# Altium schematic sheet auto-psu_E3_schematic.SchDoc: Блок автономного
size 420 x 297 mm; Author: Советников; Organization: ООО "Аксима"; DocumentNumber: Э3; SheetNumber: 1; SheetTotal: 1; Title2str: питания (v3); SheetType: Схема электрическая принципиальная
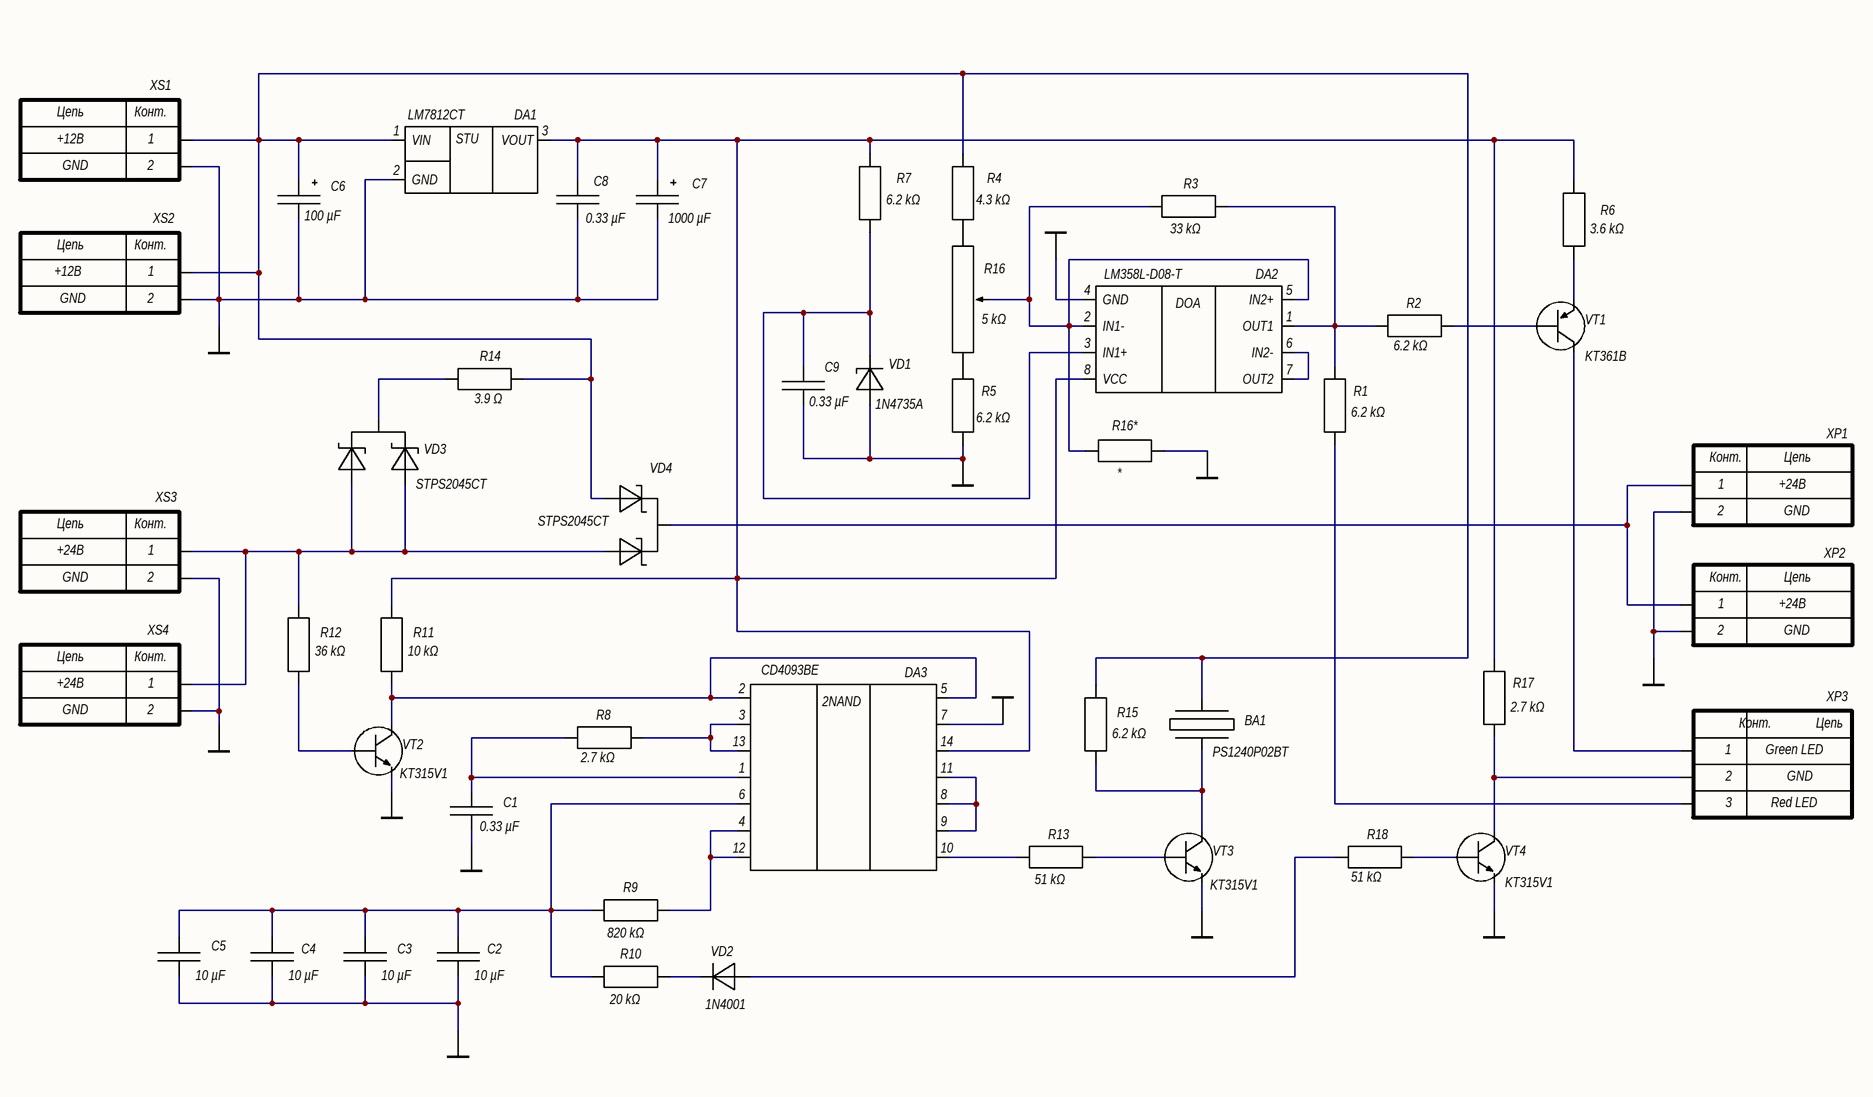
[diagram p0: auto-psu_E3_schematic.SchDoc]

## Parts
BA1  PS1240P02BT  [BA_PS12 BUZZER]
C1  0.33 µF  [C_MLCC]
C2  10 µF  [C_MLCC]
C3  10 µF  [C_MLCC]
C4  10 µF  [C_MLCC]
C5  10 µF  [C_MLCC]
C6  100 µF  [C+_6,3 MM]
C7  1000 µF  [C+_10MM]
C8  0.33 µF  [C_MLCC]
C9  0.33 µF  [C_MLCC]
DA1  LM7812CT  [DD_TO-220]
DA2  LM358L-D08-T  [DA_DIP8]
DA3  CD4093BE  [DA_DIP14]
R1  6.2 kΩ  [R_CF-25_C1-4]
R2  6.2 kΩ  [R_CF-25_C1-4]
R3  33 kΩ  [R_CF-25_C1-4]
R4  4.3 kΩ  [R_CF-25_C1-4]
R5  6.2 kΩ  [R_CF-25_C1-4]
R6  3.6 kΩ  [R_CF-25_C1-4]
R7  6.2 kΩ  [R_CF-25_C1-4]
R8  2.7 kΩ  [R_CF-25_C1-4]
R9  820 kΩ  [R_CF-25_C1-4]
R10  20 kΩ  [R_CF-25_C1-4]
R11  10 kΩ  [R_CF-25_C1-4]
R12  36 kΩ  [R_CF-25_C1-4]
R13  51 kΩ  [R_CF-25_C1-4]
R14  3.9 Ω  [R_SQP 5W]
R15  6.2 kΩ  [R_CF-25_C1-4]
R16  5 kΩ  [R_3362P(POT)]
R16*  *  [R_CF-25_C1-4]
R17  2.7 kΩ  [R_CF-25_C1-4]
R18  51 kΩ  [R_CF-25_C1-4]
VD1  1N4735A  [VD_DO-41]
VD2  1N4001  [VD_DO-41]
VD3  STPS2045CT  [VD_TO-220AB]
VD4  STPS2045CT  [VD_TO-220AB (HIGH)]
VT1  KT361B  [VT_KT-13]
VT2  KT315V1  [VT_TO-92]
VT3  KT315V1  [VT_TO-92]
VT4  KT315V1  [VT_TO-92]
XP1  15EDGVC-3.5-02  [X_15EDGVC_2P]  (value not drawn)
XP2  15EDGRC-3.5-02  [X_15EDGRC_2P]  (value not drawn)
XP3  15EDGVC-3.5-03P-14-00AH  [X_15EDGVC_3P]  (value not drawn)
XS1  15EDGVC-3.5-02  [X_15EDGVC_2P]  (value not drawn)
XS2  15EDGRC-3.5-02  [X_15EDGRC_2P]  (value not drawn)
XS3  15EDGVC-3.5-02  [X_15EDGVC_2P]  (value not drawn)
XS4  15EDGRC-3.5-02  [X_15EDGRC_2P]  (value not drawn)

## Nets
GND: C1.1 C2.1 C3.1 C4.1 C5.1 C6.1 C7.1 C8.1 C9.1 DA1.2(GND) DA2.4(GND) DA3.7 R5.1 R16*.1 VD1.1 VT2.3(Э) VT3.3(Э) VT4.3(Э) XP1.2 XP2.2 XS1.2 XS2.2 XS3.2 XS4.2
NetBA1_1: BA1.1 C6.2 DA1.1(VIN) R4.2 R14.2 R15.2 VD4.3(A2) XS1.1 XS2.1
NetBA1_2: BA1.2 R15.1 VT3.2(К)
NetC1_2: C1.2 DA3.1 R8.2
NetC2_2: C2.2 C3.2 C4.2 C5.2 DA3.6 R9.2 R10.2
NetC7_2: C7.2 C8.2 DA1.3(VOUT) DA2.8(VCC) DA3.14 R6.2 R7.2 R11.1 R17.1
NetC9_2: C9.2 DA2.3(IN1+) R7.1 VD1.2
NetDA2_1: DA2.1(OUT1) R1.2 R2.2 R3.1
NetDA2_2: DA2.2(IN1-) DA2.5(IN2+) R3.2 R16.3 R16*.2
NetDA2_6: DA2.6(IN2-) DA2.7(OUT2)
NetDA3_2: DA3.2 DA3.5 R11.2 VT2.2(К)
NetDA3_3: DA3.3 DA3.13 R8.1
NetDA3_4: DA3.4 DA3.12 R9.1
NetDA3_8: DA3.8 DA3.9 DA3.11
NetDA3_10: DA3.10 R13.1
NetR1_1: R1.1 XP3.3
NetR2_1: R2.1 VT1.1(Б)
NetR4_1: R4.1 R16.2
NetR5_2: R5.2 R16.1
NetR6_1: R6.1 VT1.3(Э)
NetR10_1: R10.1 VD2.2
NetR12_1: R12.1 VD3.1(A1) VD3.3(A2) VD4.1(A1) XS3.1 XS4.1
NetR12_2: R12.2 VT2.1(Б)
NetR13_2: R13.2 VT3.1(Б)
NetR14_1: R14.1 VD3.2(K)
NetR17_2: R17.2 VT4.2(К) XP3.2
NetR18_1: R18.1 VD2.1
NetR18_2: R18.2 VT4.1(Б)
NetVD4_2: VD4.2(K) XP1.1 XP2.1
NetVT1_2: VT1.2(К) XP3.1

## Notes on the sheet
- +12В
- GND
- +24В
- Green LED
- Red LED
- Перв. примен.
- Справ. №
- Подп. и дата
- Инв. № дубл.
- Взам. инв. №
- Разраб.
- Изм.
- Лист
- № докум.
- Подп.
- Дата
- Лит.
- Масса
- Масштаб
- Пров.
- Т.контр.
- Листов
- Инв. № подл.
- Утв.
- Н.контр.
- Копировал
- Формат А3
- (in symbol DA_LM358) DOA
- (in symbol DA_Voltage_Regulator) STU
- (in symbol DD_CD4093BE) 2NAND
- (in symbol XP_Connector_2Pin) Конт.; Цепь
- (in symbol XP_Connector_3Pin) Конт.; Цепь
- (in symbol XS_Connector_2Pin) Цепь; Конт.

## Library data of the parts
BA1 = BA_Piezo_Buzzer: Piezoelectric sounder; Value: PS1240P02BT
C1-C5 C8 C9 = C_NonPolarized: Capacitor, 50 V, 10%
  C1 C8 C9: Value: 0.33 µF
  C2-C5: Value: 10 µF
C6 = C_Polarized: Capacitor, 35 V, 20%; Value: 100 µF
C7 = C_Polarized: Capacitor, 16 V, 20%; Value: 1000 µF
DA1 = DA_Voltage_Regulator: Linear voltage regulator, 12 V; Value: LM7812CT
DA2 = DA_LM358: Dual operational amplifier; Value: LM358L-D08-T
DA3 = DD_CD4093BE: Quad two-input Schmitt-trigger NAND gate; Value: CD4093BE
R1-R13 R15 R17 R18 = R_Resistor: Carbon-film resistor, 0.25 W, 5%
  R1 R2 R5 R7 R15: Value: 6.2 kΩ
  R3: Value: 33 kΩ
  R4: Value: 4.3 kΩ
  R6: Value: 3.6 kΩ
  R8 R17: Value: 2.7 kΩ
  R9: Value: 820 kΩ
  R10: Value: 20 kΩ
  R11: Value: 10 kΩ
  R12: Value: 36 kΩ
  R13 R18: Value: 51 kΩ
R14 = R_Resistor: Wirewound resistor, 5 W, 5%; Value: 3.9 Ω
R16 = R_Potentiometer: Potentiometer; Value: 5 kΩ
R16* = R_Resistor: Fixed resistor; Value: *
VD1 = VD_Zener: Zener diode, 6.2 V; Value: 1N4735A
VD2 = VD_Diode: Rectifier diode, 1 A, 50 V; Value: 1N4001
VD3 VD4 = VD_Dual_Schottky: Dual Schottky rectifier, 2 x 10 A, 45 V; Value: STPS2045CT
VT1 = VT_Bipolar-PNP: PNP bipolar transistor; Value: KT361B
VT2-VT4 = VT_Bipolar-NPN: NPN bipolar transistor; Value: KT315V1
XP1 XP2 = XP_Connector_2Pin: 2-pin connector (plug)
  XP1: Value: 15EDGVC-3.5-02
  XP2: Value: 15EDGRC-3.5-02
XP3 = XP_Connector_3Pin: 3-pin connector (plug); Value: 15EDGVC-3.5-03P-14-00AH
XS1-XS4 = XS_Connector_2Pin: 2-pin connector (socket)
  XS1 XS3: Value: 15EDGVC-3.5-02
  XS2 XS4: Value: 15EDGRC-3.5-02